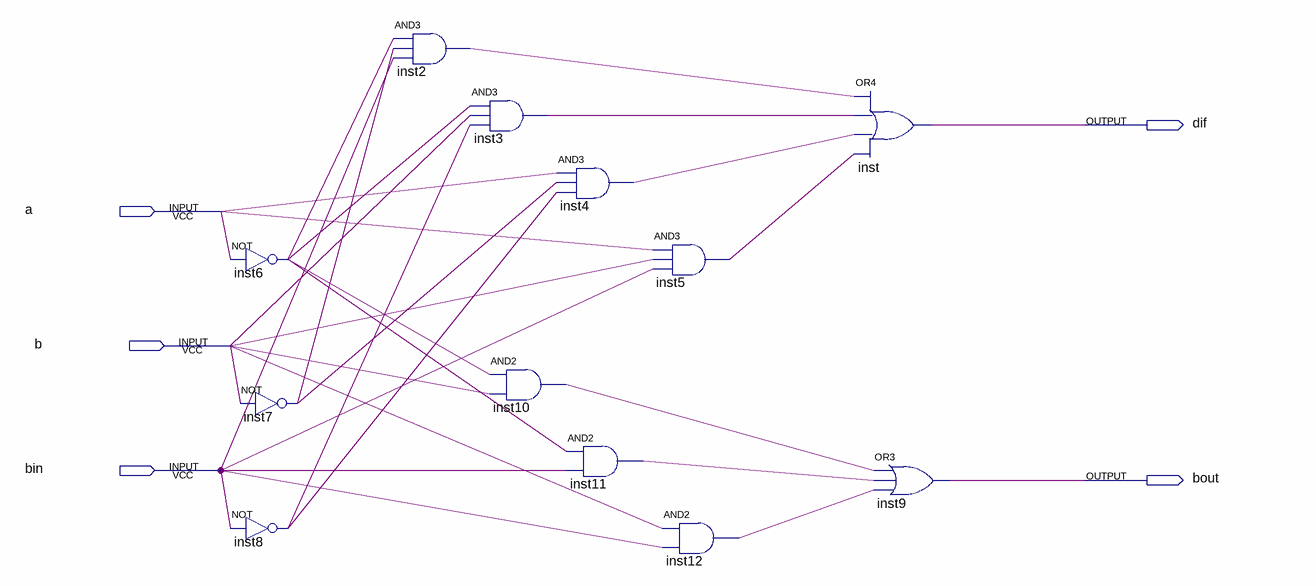
[diagram p0: schematic sheet]
// Quartus schematic fullsubtractor.bdf as structural Verilog: 12 symbols, 5 pins
module fullsubtractor (
  input  a,
  input  b,
  input  bin,
  output dif,
  output bout
);

  wire inst2_out, inst3_out, inst4_out, inst5_out, inst6_out, inst7_out, inst8_out, inst10_out, inst11_out,
       inst12_out;

  not inst6 (inst6_out, a);
  not inst7 (inst7_out, b);
  not inst8 (inst8_out, bin);
  and inst2 (inst2_out, inst6_out, inst7_out, bin);
  and inst3 (inst3_out, inst6_out, b, inst8_out);
  and inst10 (inst10_out, inst6_out, b);
  and inst4 (inst4_out, a, inst7_out, inst8_out);
  and inst11 (inst11_out, inst6_out, bin);
  and inst5 (inst5_out, a, b, bin);
  and inst12 (inst12_out, b, bin);
  or inst (dif, inst2_out, inst3_out, inst4_out, inst5_out);
  or inst9 (bout, inst10_out, inst11_out, inst12_out);
endmodule
